# Altium schematic sheet I2C-To-GPIO-Expander.SchDoc
size A4; SheetNumber: 3; SheetTotal: 5
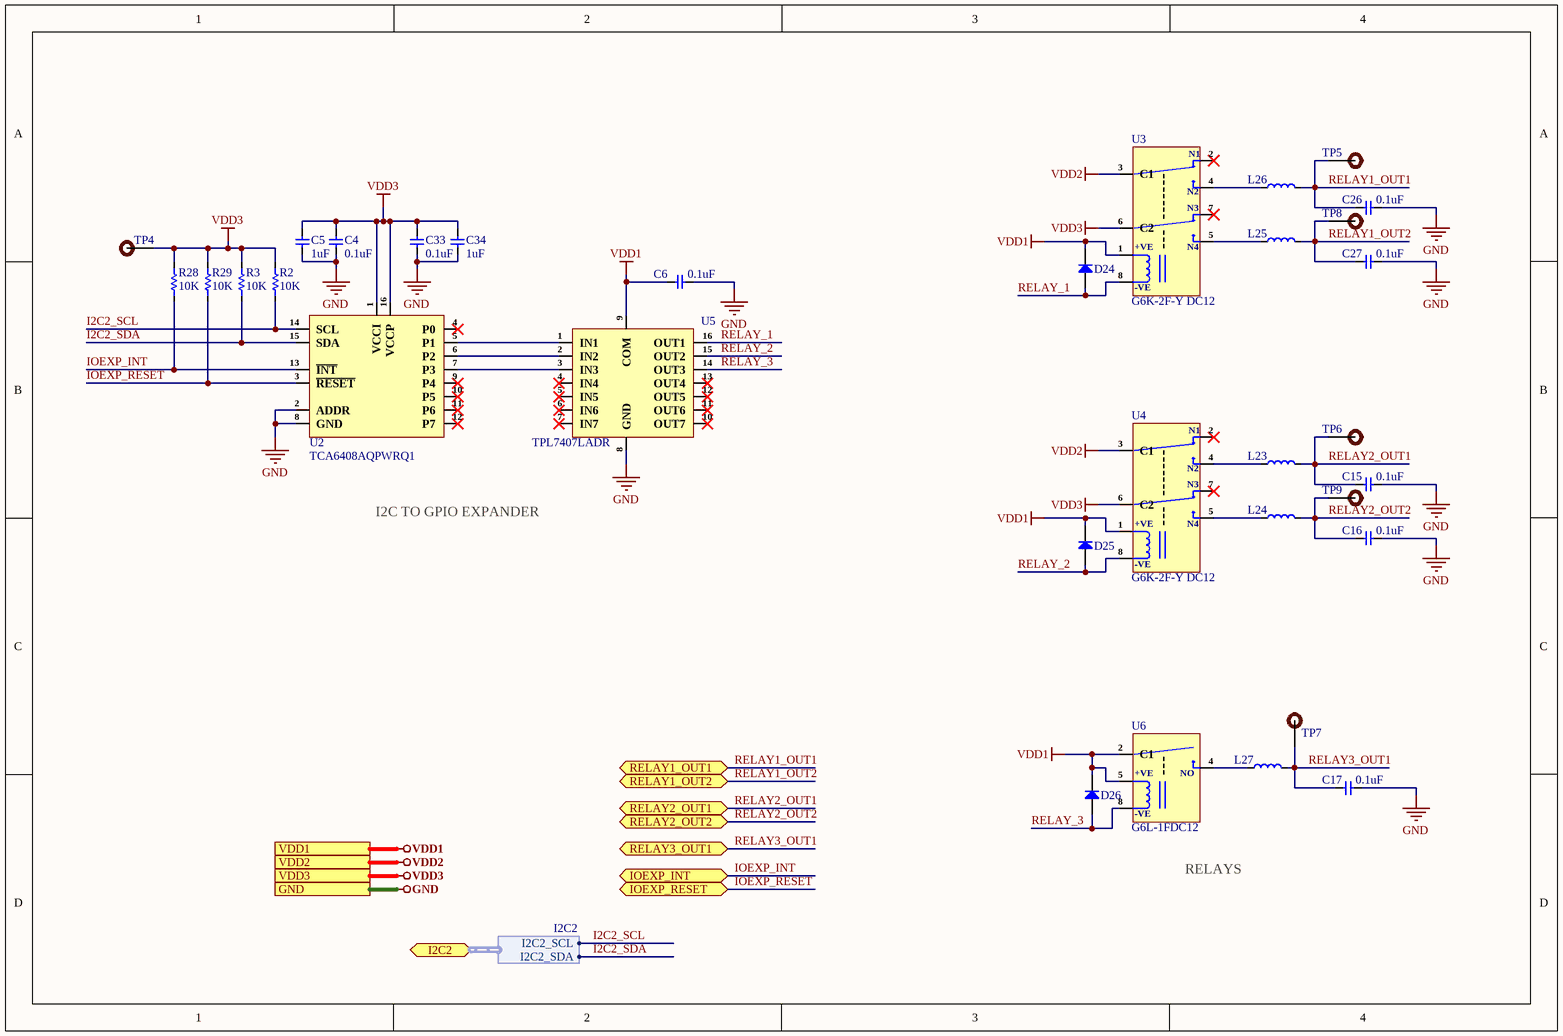
[diagram p0: I2C-To-GPIO-Expander.SchDoc]

## Parts
C4  0.1uF  [Cap-0402]
C5  1uF  [Cap-0603]
C6  0.1uF  [Cap-0603]
C15  0.1uF  [Cap-0603]
C16  0.1uF  [Cap-0603]
C17  0.1uF  [Cap-0603]
C26  0.1uF  [Cap-0603]
C27  0.1uF  [Cap-0603]
C33  0.1uF  [Cap-0402]
C34  1uF  [Cap-0603]
D24  LL4148-GS08  [SOD-80 MiniMELF]  (value not drawn)
D25  LL4148-GS08  [SOD-80 MiniMELF]  (value not drawn)
D26  LL4148-GS08  [SOD-80 MiniMELF]  (value not drawn)
L23  BLM21AG121SZ1D  [Ind-0805]  (value not drawn)
L24  BLM21AG121SZ1D  [Ind-0805]  (value not drawn)
L25  BLM21AG121SZ1D  [Ind-0805]  (value not drawn)
L26  BLM21AG121SZ1D  [Ind-0805]  (value not drawn)
L27  BLM21AG121SZ1D  [Ind-0805]  (value not drawn)
R2  10K  [Res-0603]
R3  10K  [Res-0603]
R28  10K  [Res-0603]
R29  10K  [Res-0603]
TP4  DNP  [Test-point]  (value not drawn)
TP5  DNP  [Test-point]  (value not drawn)
TP6  DNP  [Test-point]  (value not drawn)
TP7  DNP  [Test-point]  (value not drawn)
TP8  DNP  [Test-point]  (value not drawn)
TP9  DNP  [Test-point]  (value not drawn)
U2  TCA6408AQPWRQ1  [TSSOP_16]
U3  G6K-2F-Y DC12  [G6K-2F-Y DC12]
U4  G6K-2F-Y DC12  [G6K-2F-Y DC12]
U5  TPL7407LADR  [16-SOIC]
U6  G6L-1FDC12  [G6L-1FDC12]

## Ports
GND (see Top-Sheet[2B], Connector-USB-Current-Limit[2D], ISOLATED-RELAYS[1D], TEMP-HUMIDITY[1D]), I2C2 (bidir, harness I2C2, see Top-Sheet[2C], Connector-USB-Current-Limit[3D]), IOEXP_INT (bidir, see Top-Sheet[2C], Connector-USB-Current-Limit[4C]), IOEXP_RESET (bidir, see Top-Sheet[2C], Connector-USB-Current-Limit[4C]), RELAY1_OUT1 (bidir, see Top-Sheet[2C], Connector-USB-Current-Limit[4C]), RELAY1_OUT2 (bidir, see Top-Sheet[2C], Connector-USB-Current-Limit[4C]), RELAY2_OUT1 (bidir, see Top-Sheet[2C], Connector-USB-Current-Limit[4C]), RELAY2_OUT2 (bidir, see Top-Sheet[2C], Connector-USB-Current-Limit[4C]), RELAY3_OUT1 (bidir, see Top-Sheet[2C], Connector-USB-Current-Limit[4C]), VDD1 (see Top-Sheet[2B], Connector-USB-Current-Limit[2D]), VDD2 (see Top-Sheet[2C], Connector-USB-Current-Limit[2D]), VDD3 (see Top-Sheet[2C], Connector-USB-Current-Limit[2D], TEMP-HUMIDITY[1D])

## Harnesses
I2C2: I2C2_SCL, I2C2_SDA

## Nets
GND: C4.1 C5.1 C6.2 C15.2 C16.2 C17.2 C26.2 C27.2 C33.1 C34.1 U2.2(ADDR) U2.8(GND) U5.8(GND) ; port GND
VDD1: C6.1 D24.1(K) D25.1(K) D26.1(K) U3.1(+VE) U4.1(+VE) U5.9(COM) U6.2(C1) U6.5(+VE) ; port VDD1
VDD2: U3.3(C1) U4.3(C1) ; port VDD2
VDD3: C4.2 C5.2 C33.2 C34.2 R2.2 R3.2 R28.2 R29.2 TP4.1 U2.1(VCCI) U2.16(VCCP) U3.6(C2) U4.6(C2) ; port VDD3
I2C2_SCL: R2.1 U2.14(SCL) ; port I2C2.I2C2_SCL
I2C2_SDA: R3.1 U2.15(SDA) ; port I2C2.I2C2_SDA
IOEXP_INT: R28.1 U2.13(~{INT}) ; port IOEXP_INT
IOEXP_RESET: R29.1 U2.3(~{RESET}) ; port IOEXP_RESET
RELAY1_OUT1: C26.1 L26.2 TP5.1 ; port RELAY1_OUT1
RELAY1_OUT2: C27.1 L25.2 TP8.1 ; port RELAY1_OUT2
RELAY2_OUT1: C15.1 L23.2 TP6.1 ; port RELAY2_OUT1
RELAY2_OUT2: C16.1 L24.2 TP9.1 ; port RELAY2_OUT2
RELAY3_OUT1: C17.1 L27.2 TP7.1 ; port RELAY3_OUT1
RELAY_1: D24.2(A) U3.8(-VE) U5.16(OUT1)
RELAY_2: D25.2(A) U4.8(-VE) U5.15(OUT2)
RELAY_3: D26.2(A) U5.14(OUT3) U6.8(-VE)
NetL23_1: L23.1 U4.4(N2)
NetL24_1: L24.1 U4.5(N4)
NetL25_1: L25.1 U3.5(N4)
NetL26_1: L26.1 U3.4(N2)
NetL27_1: L27.1 U6.4(NO)
NetU2_5: U2.5(P1) U5.1(IN1)
NetU2_6: U2.6(P2) U5.2(IN2)
NetU2_7: U2.7(P3) U5.3(IN3)

Not connected (* = marked no-connect by the designer): U2 4(P0)* 9(P4)* 10(P5)* 11(P6)* 12(P7)*; U3 2(N1)* 7(N3)*; U4 2(N1)* 7(N3)*; U5 4(IN4)* 5(IN5)* 6(IN6)* 7(IN7)* 10(OUT7)* 11(OUT6)* 12(OUT5)* 13(OUT4)*

## Notes on the sheet
- I2C TO GPIO EXPANDER
- (near U6) RELAYS

## Library data of the parts
C4 C33 = GRM155R71C104KA88J: CAP CER 0.1UF 16V X7R 0402; Manufacturer: Murata; Material: 4241ConductorMaterial; Value: 100nF; Tolerance: 10%; Supplier: Arrow Electronics; Supplier Part Number: GRM155R71C104KA88J; Manufacturer Part Number: GRM155R71C104KA88J; RoHS: Yes; Category: Ceramic Capacitors; Stock: 300000; Pricing: 50000=0.004, 100000=0.0034, 150000=0.0033 (USD); Mounting Technology: Surface Mount; Case/Package: 0402; Pins: 2NUMBER; Case Code (Metric): 1005; Case Code (Imperial): 0402; Min Operating Temperature: -55°C; Max Operating Temperature: 125°C; Package Quantity: 1; Voltage Rating: 16V; Packaging: Tape and Reel; Dielectric: X7R; Voltage Rating (DC): 16V; Termination: SMD/SMT; Voltage: 16V; Series: GRM; Construction: Flat; Length: 1mm; Width: 0.02inch; Height: 0.5mm; Thickness: 0.022inch; Depth: 0.5mm; Radiation Hardening: No; Reach SVHC Compliant: No; Lead Free: Lead Free; RoHS Compliant: Yes; ComponentLink1URL: https://datasheet.ciiva.com/6271/product-6271168.pdf?src-supplier=Digi-Key; ComponentLink1Description: https://datasheet.ciiva.com/6271/product-6271168.pdf?src-supplier=Digi-Key; ComponentLink2URL: https://datasheet.ciiva.com/6271/grm155r71c104ka88-01-6271231.pdf?src-supplier=Digi-Key; ComponentLink2Description: https://datasheet.ciiva.com/6271/grm155r71c104ka88-01-6271231.pdf?src-supplier=Digi-Key
C5 C34 = CGA3E1X7R1E105K080AC: CAP CER 1UF 25V X7R 0603; Manufacturer: TDK; Material: 4241ConductorMaterial; Tolerance: 10%; Supplier: Rs; Supplier Part Number: 7882925P; Manufacturer Part Number: CGA3E1X7R1E105K080AC; RoHS: Yes; Category: Ceramic Capacitors; Stock: 80700; Pricing: 800=0.027, 2000=0.026 (GBP); Mounting Technology: Surface Mount; Case/Package: 0603; Case Code (Metric): 1608; Case Code (Imperial): 0603; Weight: 7.1E-05oz; Min Operating Temperature: -55°C; Max Operating Temperature: 125°C; Value: 1uF; Packaging: Tape and Reel; Dielectric: X7R; Voltage Rating: 25V; Package Quantity: 1; Voltage Rating (DC): 25V; Termination: SMD/SMT; Voltage: 25V; Series: CGA; Length: 1.6mm; Width: 0.031inch; Height: 0.8mm; Depth: 0.8mm; Thickness: 0.035inch; Ratings: AEC-Q200; Lead Free: Lead Free; Reach SVHC Compliant: No; RoHS Compliant: Yes; ComponentLink1URL: https://datasheet.ciiva.com/24216/cga3e1x7r1e105k080ac-265757-24216362.pdf?src-supplier=Mouser; ComponentLink1Description: https://datasheet.ciiva.com/24216/cga3e1x7r1e105k080ac-265757-24216362.pdf?src-supplier=Mouser; ComponentLink2URL: https://datasheet.ciiva.com/23803/1936565-23803078.pdf?src-supplier=Newark; ComponentLink2Description: https://datasheet.ciiva.com/23803/1936565-23803078.pdf?src-supplier=Newark; ComponentLink3URL: https://datasheet.ciiva.com/46385/1735392-46385705.pdf?src-supplier=Element14; ComponentLink3Description: https://datasheet.ciiva.com/46385/1735392-46385705.pdf?src-supplier=Element14; ComponentLink4URL: https://datasheet.ciiva.com/48573/2288cga3e1x7r1e105k080ac-48573708.pdf?src-supplier=Onlinecomponents.com; ComponentLink4Description: https://datasheet.ciiva.com/48573/2288cga3e1x7r1e105k080ac-48573708.pdf?src-supplier=Onlinecomponents.com; ComponentLink5URL: https://datasheet.ciiva.com/16428/mlccspec-automotive-general-midvoltage-en-16428542.pdf?src-supplier=Future+Electronics; ComponentLink5Description: https://datasheet.ciiva.com/16428/mlccspec-automotive-general-midvoltage-en-16428542.pdf?src-supplier=Future+Electronics
C6 C15-C17 C26 C27 = GRM188R72A104KA35D: CAP CER 0.1UF 100V X7R 0603; Manufacturer: Murata; Material: Ceramic; Value: 100nF; Tolerance: 10%; Supplier: Arrow Electronics; Supplier Part Number: GRM188R72A104KA35D; Manufacturer Part Number: GRM188R72A104KA35D; RoHS: Yes; Category: Ceramic Capacitors; Stock: 28393; Pricing: 1=0.1781, 10=0.0788, 25=0.078, 100=0.0455, 250=0.045, 500=0.0427, 1000=0.0376, 3000=0.0371, 6000=0.0368, 15000=0.0319 (USD); Mounting Technology: Surface Mount; Case/Package: 0603; Weight: 0.000222oz; Case Code (Imperial): 0603; Case Code (Metric): 1608; Min Operating Temperature: -55°C; Max Operating Temperature: 125°C; Dielectric: X7R; Voltage Rating: 100V; Voltage Rating (DC): 100V; Packaging: Tape and Reel; Package Quantity: 1; Termination: SMD/SMT; Voltage: 100V; Series: GRM; Construction: Flat; Length: 1.6mm; Width: 0.031inch; Height: 0.8mm; Thickness: 0.035inch; Depth: 0.8mm; Size: 0.8mm; Radiation Hardening: No; Reach SVHC Compliant: No; Lead Free: Lead Free; RoHS Compliant: Yes; ComponentLink1URL: https://datasheet.ciiva.com/18100/getdatasheetpartid-27818-18100710.pdf?src-supplier=Verical; ComponentLink1Description: https://datasheet.ciiva.com/18100/getdatasheetpartid-27818-18100710.pdf?src-supplier=Verical; ComponentLink2URL: https://datasheet.ciiva.com/22703/1747473-22703345.pdf?src-supplier=Element14; ComponentLink2Description: https://datasheet.ciiva.com/22703/1747473-22703345.pdf?src-supplier=Element14; ComponentLink3URL: https://datasheet.ciiva.com/34302/1857815-34302863.pdf?src-supplier=Jameco; ComponentLink3Description: https://datasheet.ciiva.com/34302/1857815-34302863.pdf?src-supplier=Jameco; ComponentLink4URL: https://datasheet.ciiva.com/11787/0900766b80ef921d-11787064.pdf?src-supplier=Rs; ComponentLink4Description: https://datasheet.ciiva.com/11787/0900766b80ef921d-11787064.pdf?src-supplier=Rs; ComponentLink5URL: https://datasheet.ciiva.com/29201/451984-da-01-en-vs-kondensator-0603-29201725.pdf?src-supplier=Conrad; ComponentLink5Description: https://datasheet.ciiva.com/29201/451984-da-01-en-vs-kondensator-0603-29201725.pdf?src-supplier=Conrad; ComponentLink6URL: https://datasheet.ciiva.com/7937/1747473-7937676.pdf?src-supplier=Element14; ComponentLink6Description: https://datasheet.ciiva.com/7937/1747473-7937676.pdf?src-supplier=Element14; ComponentLink7URL: https://datasheet.ciiva.com/135/partnumbering-e-01-135140.pdf?src-supplier=Digi-Key; ComponentLink7Description: https://datasheet.ciiva.com/135/partnumbering-e-01-135140.pdf?src-supplier=Digi-Key; ComponentLink8URL: https://datasheet.ciiva.com/135/partnumbering-e-01-135139.pdf?src-supplier=Digi-Key; ComponentLink8Description: https://datasheet.ciiva.com/135/partnumbering-e-01-135139.pdf?src-supplier=Digi-Key; ComponentLink9URL: https://datasheet.ciiva.com/135/partnumbering-e-01-135141.pdf?src-supplier=Digi-Key; ComponentLink9Description: https://datasheet.ciiva.com/135/partnumbering-e-01-135141.pdf?src-supplier=Digi-Key; ComponentLink10URL: https://datasheet.ciiva.com/16382/product-16382965.pdf?src-supplier=Future+Electronics; ComponentLink10Description: https://datasheet.ciiva.com/16382/product-16382965.pdf?src-supplier=Future+Electronics
D24-D26 = LL4148-GS08: DIODE GEN PURP 75V 300MA SOD80; Manufacturer: Vishay; Max Power Dissipation: 500mW; Forward Current: 150mA; Reverse Recovery Time: 8ns; Peak Non-Repetitive Surge Current: 2A; Max Repetitive Reverse Voltage (Vrrm): 100V; Primary Type: SWITCHING; Outside Diameter: 1.5mm; Supplier: Mouser; Supplier Part Number: 78-LL4148; Manufacturer Part Number: LL4148-GS08; RoHS: Yes; Category: Rectifier Diodes; Stock: 423192; Pricing: 1=0.14, 10=0.126, 50=0.126, 100=0.06, 500=0.037, 1000=0.028, 2500=0.022, 10000=0.019, 25000=0.017, 50000=0.015 (USD); Mounting Technology: Surface Mount; Pins: 2; Min Operating Temperature: -65°C; Max Operating Temperature: 175°C; Packaging: Cut Tape; Package Quantity: 1; Average Rectified Current: 300mA; Power Dissipation: 500mW; Max Forward Surge Current (Ifsm): 2A; Termination: SMD/SMT; Current Rating: 150mA; Voltage: 100V; Max Reverse Voltage (DC): 75V; Series: -; Reverse Recovery Time-Max: 8ns; Diameter: 1.6mm; Length: 3.7mm; Radiation Hardening: No; Lead Free: Lead Free; RoHS Compliant: Yes; Reach SVHC Compliant: Unknown; ComponentLink1URL: https://datasheet.ciiva.com/4246/ll4148-4246131.pdf?src-supplier=Arrow+Electronics; ComponentLink1Description: https://datasheet.ciiva.com/4246/ll4148-4246131.pdf?src-supplier=Arrow+Electronics; ComponentLink2URL: https://datasheet.ciiva.com/1243/1353494-1243008.pdf?src-supplier=Newark; ComponentLink2Description: https://datasheet.ciiva.com/1243/1353494-1243008.pdf?src-supplier=Newark; ComponentLink3URL: https://datasheet.ciiva.com/34301/891018-34301682.pdf?src-supplier=Jameco; ComponentLink3Description: https://datasheet.ciiva.com/34301/891018-34301682.pdf?src-supplier=Jameco; ComponentLink4URL: https://datasheet.ciiva.com/1181/1513919-1181029.pdf?src-supplier=Element14; ComponentLink4Description: https://datasheet.ciiva.com/1181/1513919-1181029.pdf?src-supplier=Element14; ComponentLink5URL: https://datasheet.ciiva.com/1243/1699941-1243749.pdf?src-supplier=Newark; ComponentLink5Description: https://datasheet.ciiva.com/1243/1699941-1243749.pdf?src-supplier=Newark; ComponentLink6URL: https://datasheet.ciiva.com/26311/1722544-26311744.pdf?src-supplier=Element14; ComponentLink6Description: https://datasheet.ciiva.com/26311/1722544-26311744.pdf?src-supplier=Element14; ComponentLink7URL: https://datasheet.ciiva.com/1181/1353494-1181031.pdf?src-supplier=Element14; ComponentLink7Description: https://datasheet.ciiva.com/1181/1353494-1181031.pdf?src-supplier=Element14; ComponentLink8URL: https://datasheet.ciiva.com/5829/1513919-5829997.pdf?src-supplier=Farnell; ComponentLink8Description: https://datasheet.ciiva.com/5829/1513919-5829997.pdf?src-supplier=Farnell; ComponentLink9URL: https://datasheet.ciiva.com/13946/ll4148-13946731.pdf?src-supplier=Digi-Key; ComponentLink9Description: https://datasheet.ciiva.com/13946/ll4148-13946731.pdf?src-supplier=Digi-Key; ComponentLink10URL: https://datasheet.ciiva.com/13946/ll4148-13946732.pdf?src-supplier=Digi-Key; ComponentLink10Description: https://datasheet.ciiva.com/13946/ll4148-13946732.pdf?src-supplier=Digi-Key; ComponentLink11URL: https://datasheet.ciiva.com/16298/ll4148-16298094.pdf?src-supplier=Future+Electronics; ComponentLink11Description: https://datasheet.ciiva.com/16298/ll4148-16298094.pdf?src-supplier=Future+Electronics; ComponentLink12URL: https://datasheet.ciiva.com/1181/1353494-1181030.pdf?src-supplier=Element14; ComponentLink12Description: https://datasheet.ciiva.com/1181/1353494-1181030.pdf?src-supplier=Element14; ComponentLink13URL: https://datasheet.ciiva.com/4434/ll4148-105055-4434938.pdf?src-supplier=Mouser; ComponentLink13Description: https://datasheet.ciiva.com/4434/ll4148-105055-4434938.pdf?src-supplier=Mouser; ComponentLink14URL: https://datasheet.ciiva.com/8287/ll4148-8287871.pdf?src-supplier=Avnet; ComponentLink14Description: https://datasheet.ciiva.com/8287/ll4148-8287871.pdf?src-supplier=Avnet; ComponentLink15URL: https://datasheet.ciiva.com/8287/ll4148-8287869.pdf?src-supplier=Avnet; ComponentLink15Description: https://datasheet.ciiva.com/8287/ll4148-8287869.pdf?src-supplier=Avnet; ComponentLink16URL: https://datasheet.ciiva.com/13946/ll4148-13946733.pdf?src-supplier=Digi-Key; ComponentLink16Description: https://datasheet.ciiva.com/13946/ll4148-13946733.pdf?src-supplier=Digi-Key; ComponentLink17URL: https://datasheet.ciiva.com/25936/ll4148-25936391.pdf?; ComponentLink17Description: https://datasheet.ciiva.com/25936/ll4148-25936391.pdf?
L23-L27 = BLM21AG121SZ1D: FERRITE BEAD 120 OHM 0805 1LN; Manufacturer: Murata; Core Material: 228ConductorMaterial; Max Current Rating: 800mA; Number of Lines: 1; Value: 90mR; RMS Current (Irms): 1A; Test Frequency: 100MHz; Tolerance: 25%; Supplier: Digi-Key; Supplier Part Number: 490-BLM21AG121SZ1DCT-ND; Manufacturer Part Number: BLM21AG121SZ1D; RoHS: Yes; Category: Ferrite Beads and Chips; Stock: 3900; Pricing: 1=0.19, 10=0.153, 25=0.1188, 50=0.0984, 100=0.0848, 250=0.06788, 500=0.06108, 1000=0.0509 (USD); Mounting Technology: Surface Mount; Case/Package: 0201; Min Operating Temperature: -55°C; Max Operating Temperature: 125°C; Series: EMIFIL®, BLM21; ESR: 90mR; Height: 1.05mm; Ratings: AEC-Q200; RoHS Compliant: Yes
R2 R3 R28 R29 = RCA060310K0FKEAHP: RES SMD 10K OHM 1% 1/10W 0603; Manufacturer: Vishay Dale; Value: 10kR; Max Power Dissipation: 250mW; Temperature Coefficient: 100ppm/°C; Supplier: Future Electronics; Supplier Part Number: 4171415; Manufacturer Part Number: RCA060310K0FKEAHP; RoHS: Yes; Category: Chip SMD Resistors; Stock: 10000; Pricing: 5000=0.0413, 10000=0.0403, 15000=0.0397, 25000=0.0389, 50000=0.0374 (USD); Case/Package: 0603; Case Code (Imperial): 0603; Case Code (Metric): 1608; Min Operating Temperature: -55°C; Max Operating Temperature: 155°C; Features: Automotive AEC-Q200,Anti-Sulfur; Packaging: Cut Tape; Tolerance: 1%; Number of Terminations: 2; Series: RCA-HP; Ratings: AEC-Q200; RoHS Compliant: Yes; ComponentLink1URL: http://www.vishay.com/docs/20067/rcahp.pdf?src-supplier=Digi-Key; ComponentLink1Description: http://www.vishay.com/docs/20067/rcahp.pdf?src-supplier=Digi-Key
TP4-TP9 = TEST POINT: Test Point ON; Item Type: TEST POINT
U2 = TCA6408AQPWRQ1: IC XPND 400KHZ I2C SMBUS 16TSSOP; Manufacturer: Texas Instruments; Supplier: Mouser; Supplier Part Number: 595-TCA6408AQPWRQ1; Manufacturer Part Number: TCA6408AQPWRQ1; RoHS: Yes; Category: Interface ICs; Stock: 12699; Pricing: 1=1.39, 10=1.22, 50=1.22, 100=0.997, 1000=0.748, 10000=0.643 (USD); ComponentLink1URL: http://www.ti.com/general/docs/suppproductinfo.tsp?distId=10&amp;gotoUrl=http%3A%2F%2Fwww.ti.com%2Flit%2Fgpn%2Ftca6408a-q1&src-supplier=Digi-Key; ComponentLink1Description: http://www.ti.com/general/docs/suppproductinfo.tsp?distId=10&amp;gotoUrl=http%3A%2F%2Fwww.ti.com%2Flit%2Fgpn%2Ftca6408a-q1&src-supplier=Digi-Key; ComponentLink2URL: http://www.ti.com/lit/ds/symlink/tca6408a-q1.pdf?src-supplier=Digi-Key; ComponentLink2Description: http://www.ti.com/lit/ds/symlink/tca6408a-q1.pdf?src-supplier=Digi-Key
U3 U4 = G6K-2F-Y DC12: RELAY TELECOM DPDT 1A 12VDC; Manufacturer: Omron; Supplier: Rs; Supplier Part Number: 2334168; Manufacturer Part Number: G6K-2F-Y DC12; RoHS: Yes; Category: Signal Relays; Stock: 2055; Pricing: 1=3.1, 10=2.99, 100=2.92, 250=2.78 (GBP)
U5 = TPL7407LADR: IC PWR DRIVER N-CHAN 1:1 16SOIC; Manufacturer: Texas Instruments; Supplier: Mouser; Supplier Part Number: 595-TPL7407LADR; Manufacturer Part Number: TPL7407LADR; RoHS: Yes; Category: Integrated Circuits (ICs); Stock: 7225; Pricing: 1=0.66, 10=0.544, 50=0.544, 100=0.407, 1000=0.252, 10000=0.197 (USD); ComponentLink1URL: http://www.ti.com/lit/ds/symlink/tpl7407la.pdf?src-supplier=Digi-Key; ComponentLink1Description: http://www.ti.com/lit/ds/symlink/tpl7407la.pdf?src-supplier=Digi-Key; ComponentLink2URL: http://www.ti.com/general/docs/suppproductinfo.tsp?distId=10&amp;gotoUrl=http%3A%2F%2Fwww.ti.com%2Flit%2Fgpn%2Ftpl7407la&src-supplier=Digi-Key; ComponentLink2Description: http://www.ti.com/general/docs/suppproductinfo.tsp?distId=10&amp;gotoUrl=http%3A%2F%2Fwww.ti.com%2Flit%2Fgpn%2Ftpl7407la&src-supplier=Digi-Key
U6 = G6L-1FDC12: RELAY TELECOM SPST 1A 12VDC; Manufacturer: Omron; Supplier: Arrow Electronics; Supplier Part Number: G6L-1F-DC12; Manufacturer Part Number: G6L-1FDC12; RoHS: Yes; Category: Signal Relays; Stock: 764; Pricing: 1=3.229, 10=2.966, 25=2.652, 50=2.416, 100=2.239, 250=2.053, 500=1.91, 1000=1.756, 5000=1.705 (USD); ComponentLink1URL: https://datasheet.ciiva.com/2416/g6l-0614-2416511.pdf?src-supplier=Digi-Key; ComponentLink1Description: https://datasheet.ciiva.com/2416/g6l-0614-2416511.pdf?src-supplier=Digi-Key; ComponentLink2URL: https://datasheet.ciiva.com/15185/getdatasheetpartid-153492-15185645.pdf?src-supplier=Verical; ComponentLink2Description: https://datasheet.ciiva.com/15185/getdatasheetpartid-153492-15185645.pdf?src-supplier=Verical